# Altium schematic sheet DongcoDC.SchDoc
size B; SheetNumber: 1; SheetTotal: 1
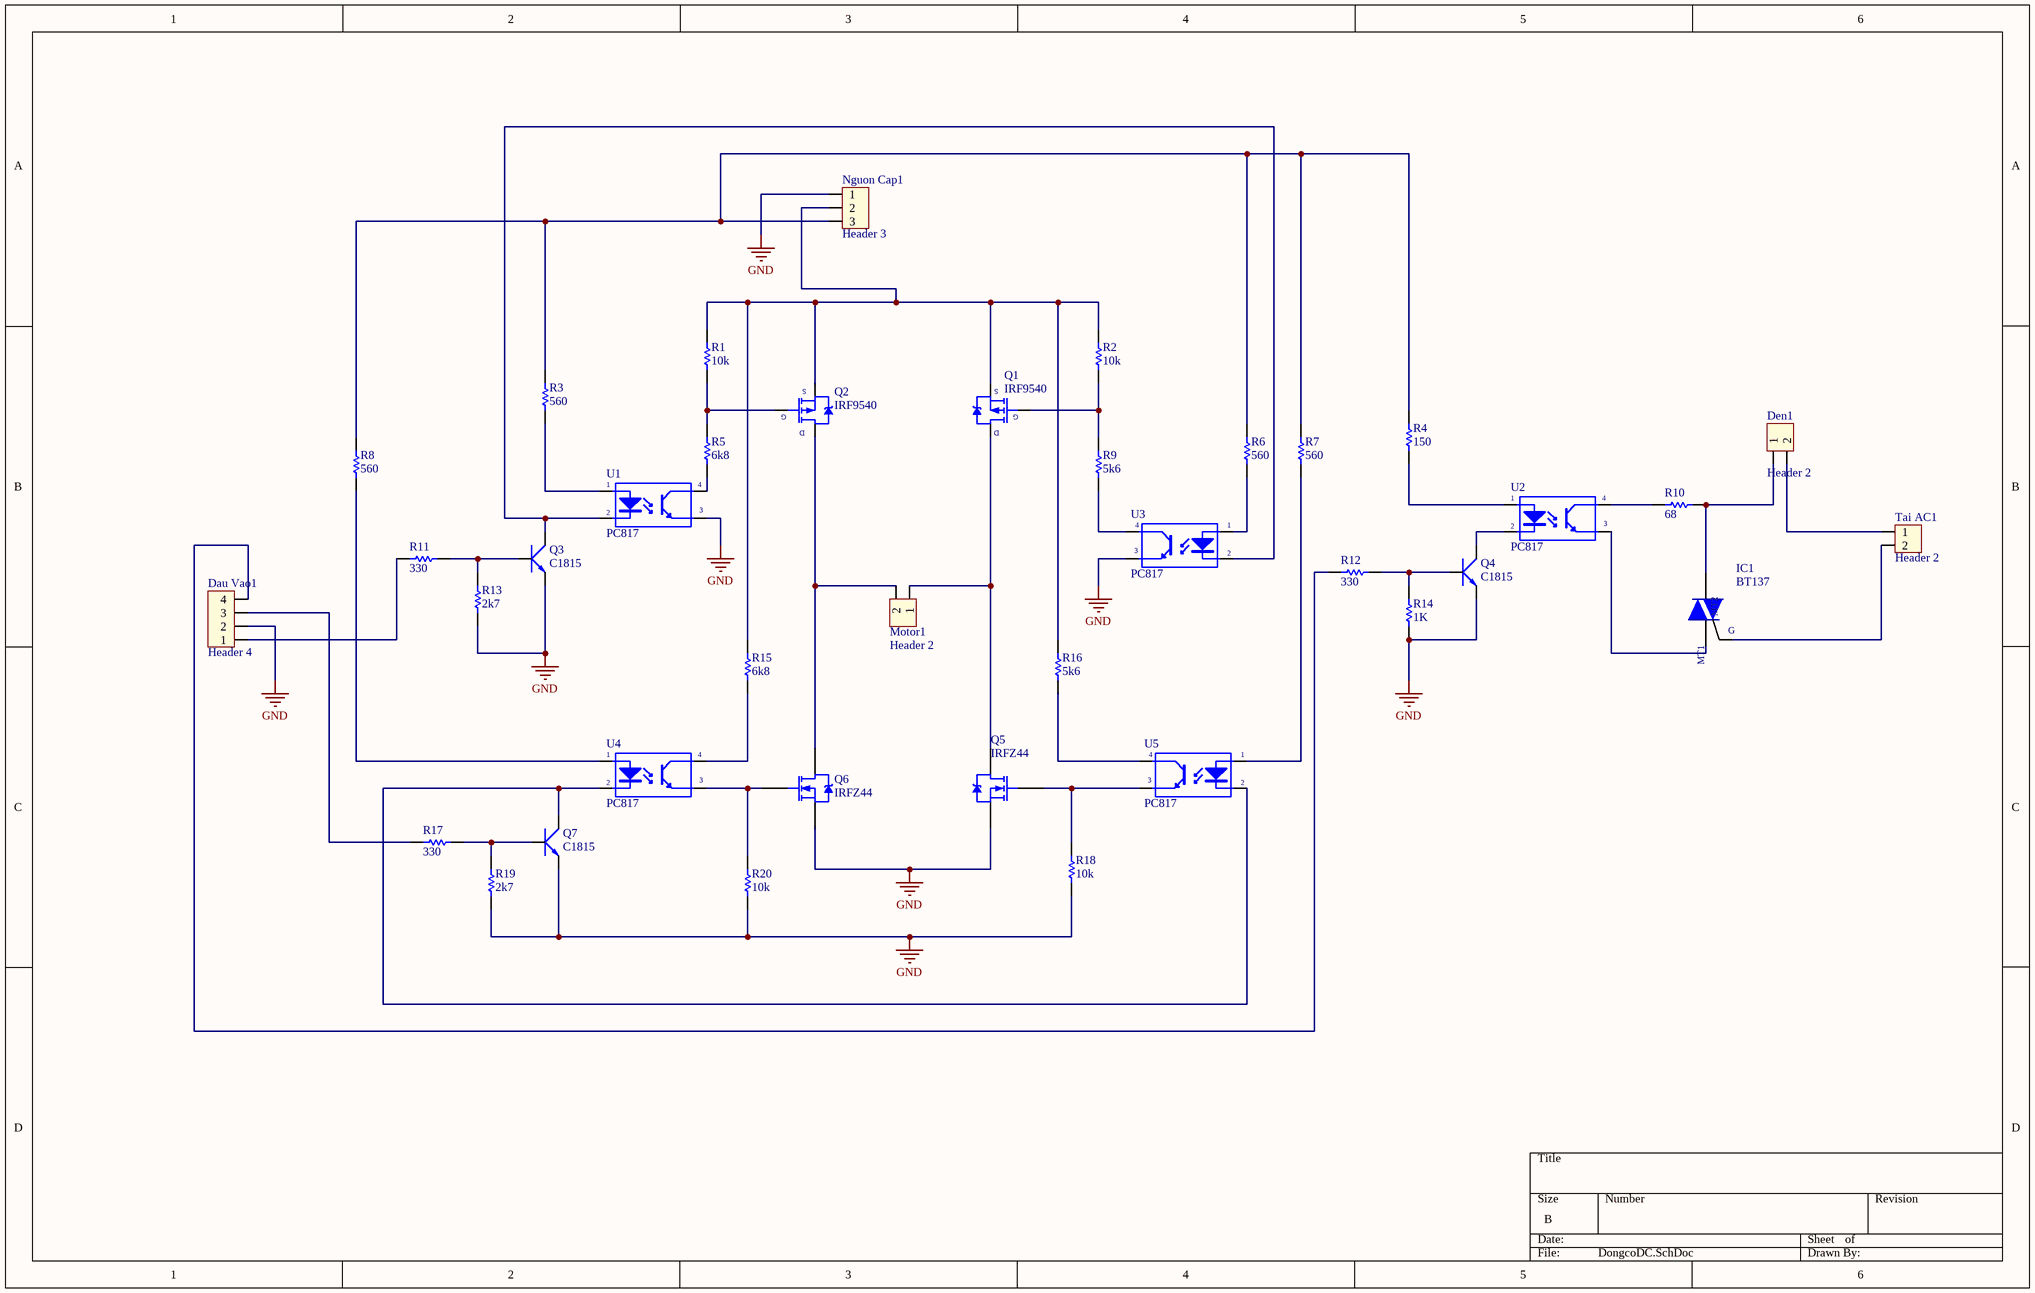
[diagram p0: DongcoDC.SchDoc]

## Parts
Dau_Vao1  Header 4  [HED4]
Den1  Header 2  [HED2]
IC1  BT137  [QTO-220]
Motor1  Header 2  [HED2]
Nguon_Cap1  Header 3  [HED3]
Q1  IRF9540  [QTO-220]
Q2  IRF9540  [QTO-220]
Q3  C1815  [QTO-92]
Q4  C1815  [QTO-92]
Q5  IRFZ44  [QTO-220H3]
Q6  IRFZ44  [QTO-220H3]
Q7  C1815  [QTO-92]
R1  value 10k  [R1/4W]  (hidden comment: Res1)
R2  value 10k  [R1/4W]  (hidden comment: Res1)
R3  value 560  [R1/4W]  (hidden comment: Res1)
R4  value 150  [R1/4W]  (hidden comment: Res1)
R5  value 6k8  [R1/4W]  (hidden comment: Res1)
R6  value 560  [R1/4W]  (hidden comment: Res1)
R7  value 560  [R1/4W]  (hidden comment: Res1)
R8  value 560  [R1/4W]  (hidden comment: Res1)
R9  value 5k6  [R1/4W]  (hidden comment: Res1)
R10  value 68  [R1/4W]  (hidden comment: Res1)
R11  value 330  [R1/4W]  (hidden comment: Res1)
R12  value 330  [R1/4W]  (hidden comment: Res1)
R13  value 2k7  [R1/4W]  (hidden comment: Res1)
R14  value 1K  [R1/4W]  (hidden comment: Res1)
R15  value 6k8  [R1/4W]  (hidden comment: Res1)
R16  value 5k6  [R1/4W]  (hidden comment: Res1)
R17  value 330  [R1/4W]  (hidden comment: Res1)
R18  value 10k  [R1/4W]  (hidden comment: Res1)
R19  value 2k7  [R1/4W]  (hidden comment: Res1)
R20  value 10k  [R1/4W]  (hidden comment: Res1)
Tai_AC1  Header 2  [HED2]
U1  PC817  [DIP4/W0.3]
U2  PC817  [DIP4/W0.3]
U3  PC817  [DIP4/W0.3]
U4  PC817  [DIP4/W0.3]
U5  PC817  [DIP4/W0.3]

## Nets
GND: Dau_Vao1.2 Nguon_Cap1.1 Q3.1(E) Q4.1(E) Q5.3(S) Q6.3(S) Q7.1(E) R13.2 R14.2 R18.2 R19.2 R20.2 U1.3(E) U3.3(E)
NetDau_Vao1_1: Dau_Vao1.1 R11.2
NetDau_Vao1_3: Dau_Vao1.3 R17.2
NetDau_Vao1_4: Dau_Vao1.4 R12.2
NetDen1_1: Den1.1 IC1.2(MT2) R10.2
NetDen1_2: Den1.2 Tai_AC1.1
NetIC1_1: IC1.1(MT1) U2.3(E)
NetIC1_3: IC1.3(IN) Tai_AC1.2
NetMotor1_1: Motor1.1 Q1.2(D) Q5.2(D)
NetMotor1_2: Motor1.2 Q2.2(D) Q6.2(D)
NetNguon_Cap1_2: Nguon_Cap1.2 Q1.3(S) Q2.3(S) R1.1 R2.1 R15.1 R16.1
NetNguon_Cap1_3: Nguon_Cap1.3 R3.1 R4.1 R6.1 R7.1 R8.1
NetQ1_1: Q1.1(G) R2.2 R9.1
NetQ2_1: Q2.1(G) R1.2 R5.1
NetQ3_2: Q3.2(C) U1.2(K) U3.2(K)
NetQ3_3: Q3.3(B) R11.1 R13.1
NetQ4_2: Q4.2(C) U2.2(K)
NetQ4_3: Q4.3(B) R12.1 R14.1
NetQ5_1: Q5.1(G) R18.1 U5.3(E)
NetQ6_1: Q6.1(G) R20.1 U4.3(E)
NetQ7_2: Q7.2(C) U4.2(K) U5.2(K)
NetQ7_3: Q7.3(B) R17.1 R19.1
NetR3_2: R3.2 U1.1(A)
NetR4_2: R4.2 U2.1(A)
NetR5_2: R5.2 U1.4(C)
NetR6_2: R6.2 U3.1(A)
NetR7_2: R7.2 U5.1(A)
NetR8_2: R8.2 U4.1(A)
NetR9_2: R9.2 U3.4(C)
NetR10_1: R10.1 U2.4(C)
NetR15_2: R15.2 U4.4(C)
NetR16_2: R16.2 U5.4(C)

## Notes on the sheet
- (in symbol BT137) G

## Library data of the parts
Dau_Vao1 = Hed4: Header 4 (Green); Value: Header 4
Den1 Motor1 Tai_AC1 = Hed2: Header 2 (Green); Value: Header 2
IC1 = BT137: Triacs - 8A; Value: LM317
Nguon_Cap1 = Hed3: Header 3 (Green); Value: Header 3
Q1 Q2 = IRF9540: HEXFET P-Channel Power MOSFET; Note: Pin 2 is electrically connected to pin 4.; Published: 8-Jun-2000; LatestRevisionDate: 17-Jul-2002; LatestRevisionNote: Re-released for DXP Platform.; DatasheetVersion: PD-9.421C; PackageVersion: Feb-1997; PackageReference: TO-220AB; Publisher: Altium Limited; PackageDescription: TO, Thru-Hole, Vertical, Heatsink Mounted; 3 In-Line Leads; Pitch 2.54 mm; ComponentLink1Description: Manufacturer Link; ComponentLink1URL: http://www.irf.com/; ComponentLink2Description: Datasheet; ComponentLink2URL: http://www.irf.com/product-info/datasheets/data/irf9540.pdf
Q3 Q4 Q7 = C1815: NPN 600mW, ECB; Value: C1815
Q5 Q6 = IRFZ44: HEXFET N-Channel Power MOSFET
R1-R20 = Res1_1: Resistor; Manufacturer: Generic Components; Class: Passive; Published: 08/06/2000; Publisher: Altium Hobart Technology Centre; SubClass: Resistor
U1-U5 = PC817: Single Opto; Value: PC817